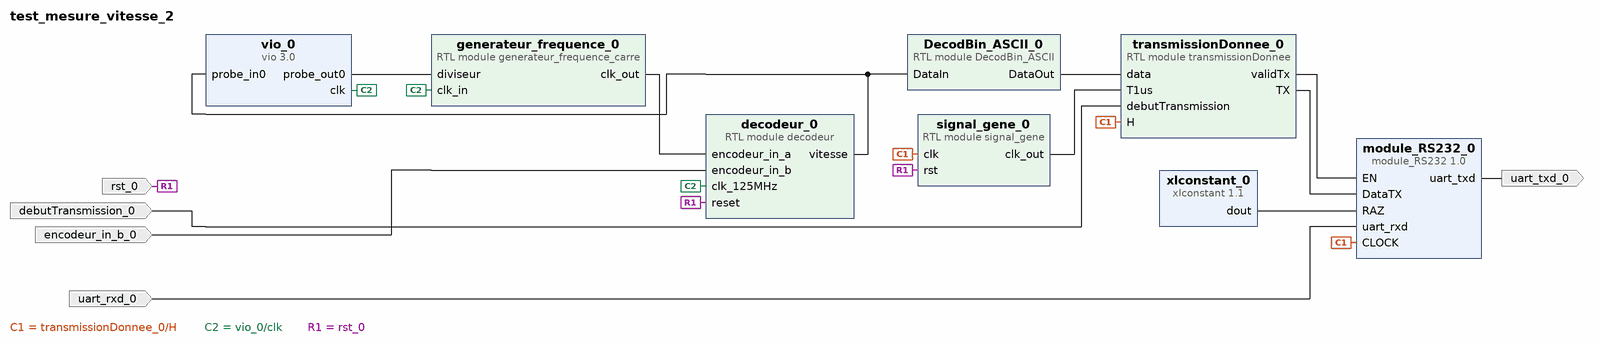
[diagram p0: block diagram of the top level]
# Vivado block design test_mesure_vitesse_2, xc7z010clg400-1, Vivado 2020.2
create_bd_design test_mesure_vitesse_2

create_bd_port -dir I debutTransmission_0
create_bd_port -dir I uart_rxd_0
create_bd_port -dir O uart_txd_0
create_bd_port -dir I -type rst rst_0
create_bd_port -dir I encodeur_in_b_0

create_bd_cell -type ip -vlnv xilinx.com:ip:vio:3.0 vio_0
set_property -dict {CONFIG.C_PROBE_IN0_WIDTH 16 CONFIG.C_PROBE_OUT0_WIDTH 32} [get_bd_cells vio_0]
create_bd_cell -type ip -vlnv u-ga.fr:user:module_RS232:1.0 module_RS232_0
create_bd_cell -type module -reference transmissionDonnee transmissionDonnee_0
set_property -dict [list \
  CONFIG.NData 1 \
  CONFIG.dataSize 5 \
  CONFIG.period 8000 \
  CONFIG.periodOctet 1000 \
] [get_bd_cells transmissionDonnee_0]
create_bd_cell -type ip -vlnv xilinx.com:ip:xlconstant:1.1 xlconstant_0
create_bd_cell -type module -reference decodeur decodeur_0
create_bd_cell -type module -reference signal_gene signal_gene_0
create_bd_cell -type module -reference generateur_frequence_carre generateur_frequence_0
create_bd_cell -type module -reference DecodBin_ASCII DecodBin_ASCII_0

# ---- connections ----

connect_bd_net [get_bd_pins DecodBin_ASCII_0/DataOut] [get_bd_pins transmissionDonnee_0/data]
connect_bd_net [get_bd_pins signal_gene_0/clk_out] [get_bd_pins transmissionDonnee_0/T1us]
connect_bd_net -net debutTransmission_0_1 [get_bd_ports debutTransmission_0] [get_bd_pins transmissionDonnee_0/debutTransmission]
connect_bd_net [get_bd_pins transmissionDonnee_0/H] [get_bd_pins module_RS232_0/CLOCK] [get_bd_pins signal_gene_0/clk]
connect_bd_net [get_bd_pins transmissionDonnee_0/validTx] [get_bd_pins module_RS232_0/EN]
connect_bd_net [get_bd_pins transmissionDonnee_0/TX] [get_bd_pins module_RS232_0/DataTX]
connect_bd_net [get_bd_pins xlconstant_0/dout] [get_bd_pins module_RS232_0/RAZ]
connect_bd_net -net uart_rxd_0_1 [get_bd_ports uart_rxd_0] [get_bd_pins module_RS232_0/uart_rxd]
connect_bd_net [get_bd_pins module_RS232_0/uart_txd] [get_bd_ports uart_txd_0]
connect_bd_net [get_bd_pins vio_0/probe_out0] [get_bd_pins generateur_frequence_0/diviseur]
connect_bd_net [get_bd_pins vio_0/clk] [get_bd_pins decodeur_0/clk_125MHz] [get_bd_pins generateur_frequence_0/clk_in]
connect_bd_net -net rst_0_1 [get_bd_ports rst_0] [get_bd_pins decodeur_0/reset] [get_bd_pins signal_gene_0/rst]
connect_bd_net [get_bd_pins decodeur_0/vitesse] [get_bd_pins vio_0/probe_in0] [get_bd_pins DecodBin_ASCII_0/DataIn]
connect_bd_net [get_bd_pins generateur_frequence_0/clk_out] [get_bd_pins decodeur_0/encodeur_in_a]
connect_bd_net -net encodeur_in_b_0_1 [get_bd_ports encodeur_in_b_0] [get_bd_pins decodeur_0/encodeur_in_b]

validate_bd_design
save_bd_design
